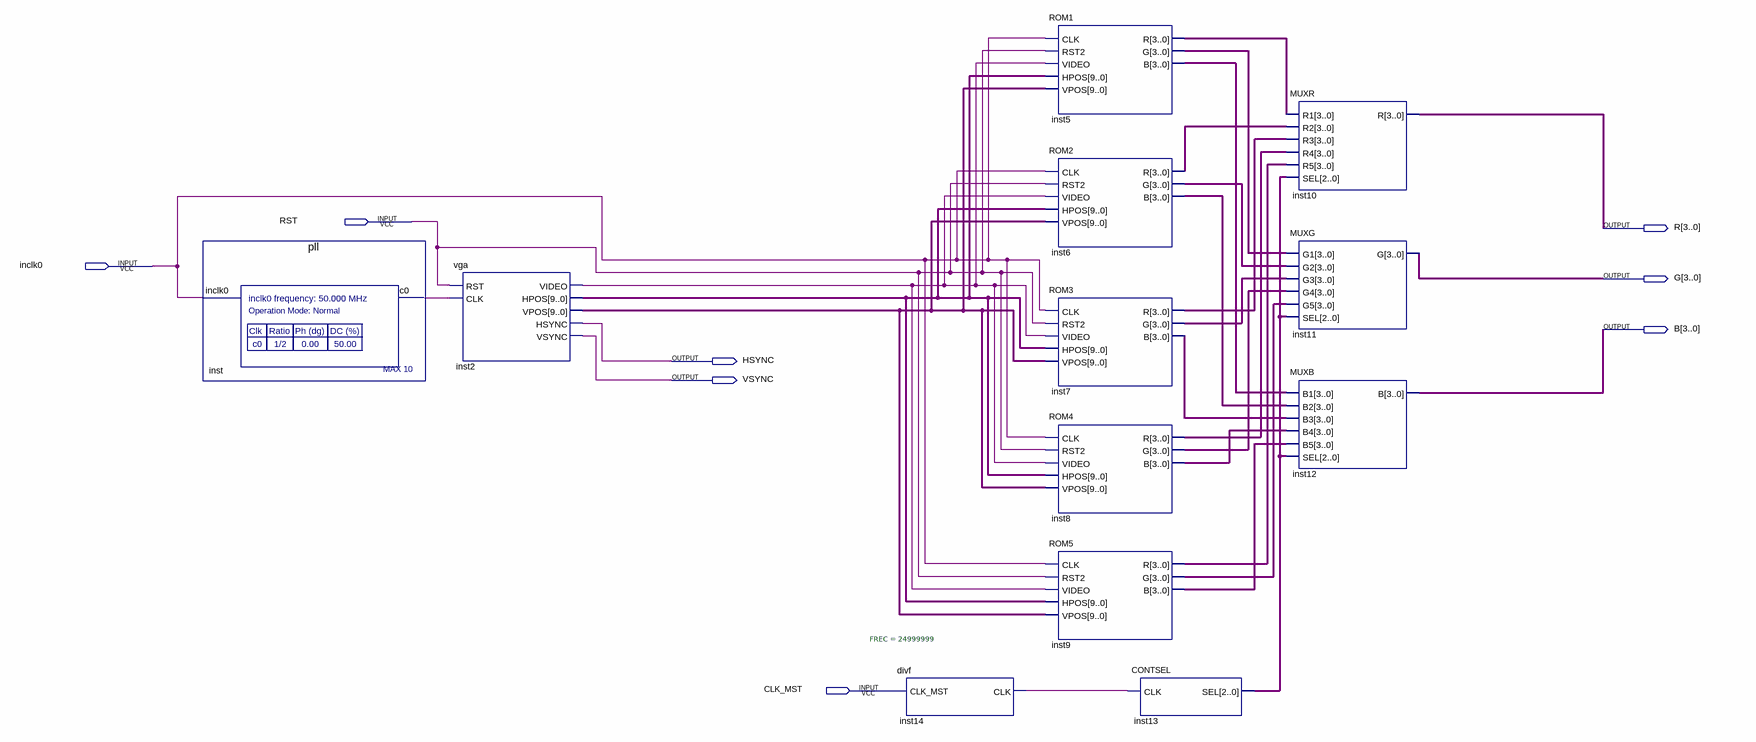
[diagram p0: schematic sheet]
// Quartus schematic VGABlockDiagram.bdf as structural Verilog: 12 symbols, 8 pins
module VGABlockDiagram (
  input  RST,
  input  inclk0,
  input  CLK_MST,
  output [3:0] R,
  output [3:0] G,
  output [3:0] B,
  output HSYNC,
  output VSYNC
);

  wire inst2_video, inst14_clk, inst_c0;
  wire [2:0] inst13_sel;
  wire [3:0] inst5_b, inst5_g, inst5_r, inst6_b, inst6_g, inst6_r, inst7_b, inst7_g, inst7_r, inst8_b,
       inst8_g, inst8_r, inst9_b, inst9_g, inst9_r;
  wire [9:0] inst2_hpos, inst2_vpos;

  pll inst (.inclk0(inclk0), .c0(inst_c0));
  vga inst2 (
    .RST(RST), .CLK(inst_c0), .VIDEO(inst2_video), .HPOS(inst2_hpos), .VPOS(inst2_vpos), .HSYNC(HSYNC),
    .VSYNC(VSYNC));
  divf #(.FREC(24999999)) inst14 (.CLK_MST(CLK_MST), .CLK(inst14_clk));
  ROM1 inst5 (
    .CLK(inclk0), .RST2(RST), .VIDEO(inst2_video), .HPOS(inst2_hpos), .VPOS(inst2_vpos), .R(inst5_r),
    .G(inst5_g), .B(inst5_b));
  ROM2 inst6 (
    .CLK(inclk0), .RST2(RST), .VIDEO(inst2_video), .HPOS(inst2_hpos), .VPOS(inst2_vpos), .R(inst6_r),
    .G(inst6_g), .B(inst6_b));
  ROM3 inst7 (
    .CLK(inclk0), .RST2(RST), .VIDEO(inst2_video), .HPOS(inst2_hpos), .VPOS(inst2_vpos), .R(inst7_r),
    .G(inst7_g), .B(inst7_b));
  ROM4 inst8 (
    .CLK(inclk0), .RST2(RST), .VIDEO(inst2_video), .HPOS(inst2_hpos), .VPOS(inst2_vpos), .R(inst8_r),
    .G(inst8_g), .B(inst8_b));
  ROM5 inst9 (
    .CLK(inclk0), .RST2(RST), .VIDEO(inst2_video), .HPOS(inst2_hpos), .VPOS(inst2_vpos), .R(inst9_r),
    .G(inst9_g), .B(inst9_b));
  CONTSEL inst13 (.CLK(inst14_clk), .SEL(inst13_sel));
  MUXR inst10 (.R1(inst5_r), .R2(inst6_r), .R3(inst7_r), .R4(inst8_r), .R5(inst9_r), .SEL(inst13_sel), .R(R));
  MUXG inst11 (.G1(inst5_g), .G2(inst6_g), .G3(inst7_g), .G4(inst8_g), .G5(inst9_g), .SEL(inst13_sel), .G(G));
  MUXB inst12 (.B1(inst5_b), .B2(inst6_b), .B3(inst7_b), .B4(inst8_b), .B5(inst9_b), .SEL(inst13_sel), .B(B));
endmodule
